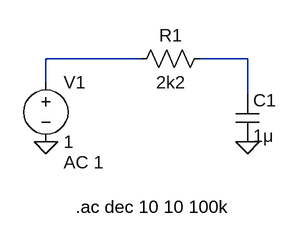
[diagram p0: schematic rc_lowpass.asc]
rc_lowpass.asc, the LTspice schematic file:
Version 4.1
SHEET 1 880 680
WIRE 128 128 0 128
WIRE 272 128 208 128
WIRE 0 160 0 128
WIRE 272 176 272 128
FLAG 272 240 0
FLAG 0 240 0
SYMBOL res 224 112 R90
WINDOW 0 0 56 VBottom 2
WINDOW 3 32 56 VTop 2
SYMATTR InstName R1
SYMATTR Value 2k2
SYMBOL cap 256 176 R0
SYMATTR InstName C1
SYMATTR Value 1μ
SYMBOL voltage 0 144 R0
WINDOW 123 24 124 Left 2
WINDOW 39 0 0 Left 0
SYMATTR InstName V1
SYMATTR Value 1
SYMATTR Value2 AC 1
TEXT 40 328 Left 2 !.ac dec 10 10 100k

The netlist it stands for:
* rc_lowpass.asc
R1 N002 N001 2k2
C1 N002 0 1μ
V1 N001 0 1 AC 1
.ac dec 10 10 100k
.backanno
.end